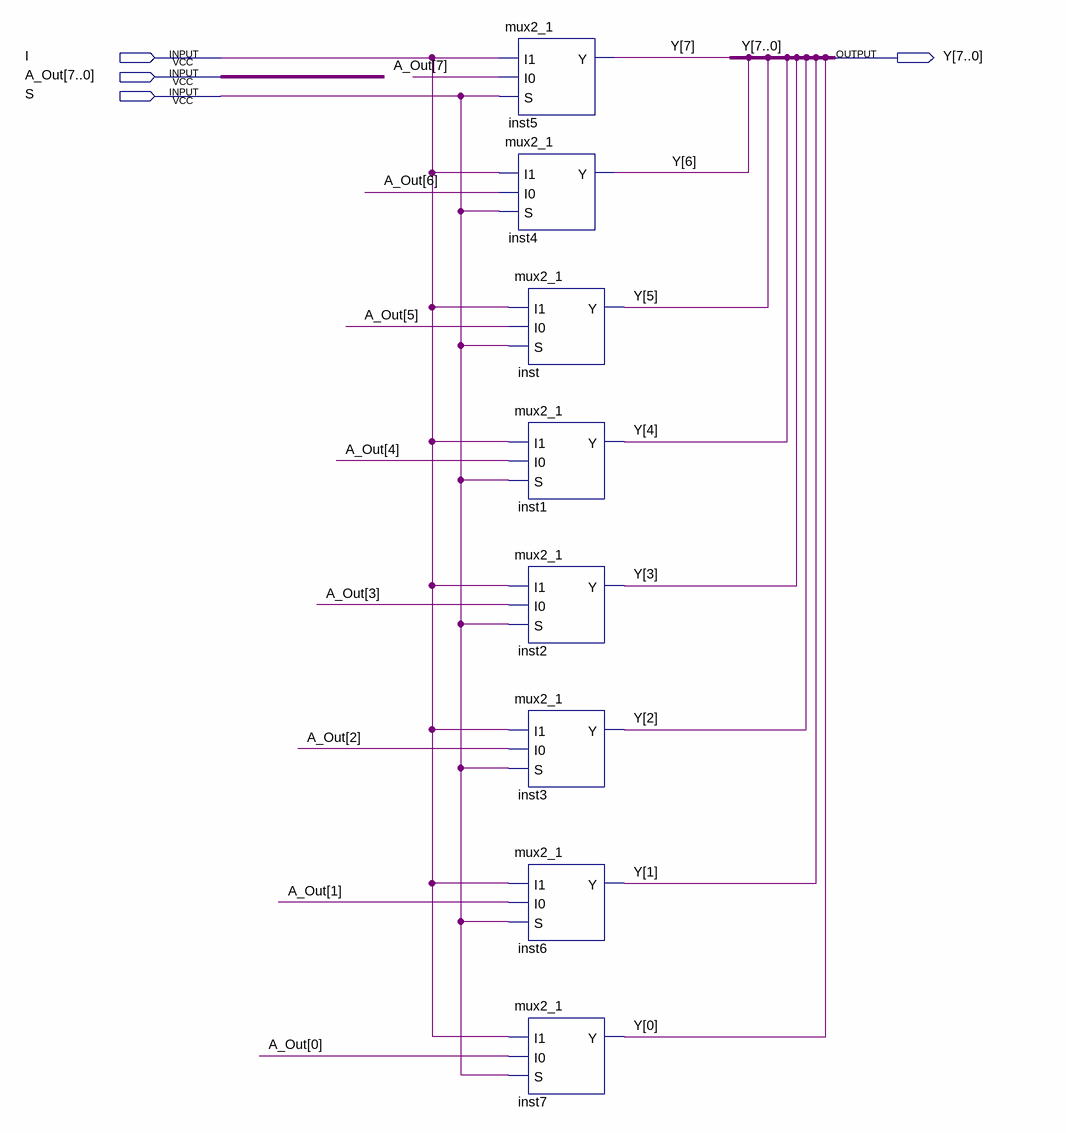
[diagram p0: schematic sheet]
// Quartus schematic mux2_1_8bit.bdf as structural Verilog: 8 symbols, 4 pins
module mux2_1_8bit (
  input  I,
  input  [7:0] A_Out,
  input  S,
  output [7:0] Y
);

  mux2_1 inst5 (.I1(I), .I0(A_Out[7]), .S(S), .Y(Y[7]));
  mux2_1 inst4 (.I1(I), .I0(A_Out[6]), .S(S), .Y(Y[6]));
  mux2_1 inst (.I1(I), .I0(A_Out[5]), .S(S), .Y(Y[5]));
  mux2_1 inst1 (.I1(I), .I0(A_Out[4]), .S(S), .Y(Y[4]));
  mux2_1 inst2 (.I1(I), .I0(A_Out[3]), .S(S), .Y(Y[3]));
  mux2_1 inst3 (.I1(I), .I0(A_Out[2]), .S(S), .Y(Y[2]));
  mux2_1 inst6 (.I1(I), .I0(A_Out[1]), .S(S), .Y(Y[1]));
  mux2_1 inst7 (.I1(I), .I0(A_Out[0]), .S(S), .Y(Y[0]));
endmodule
